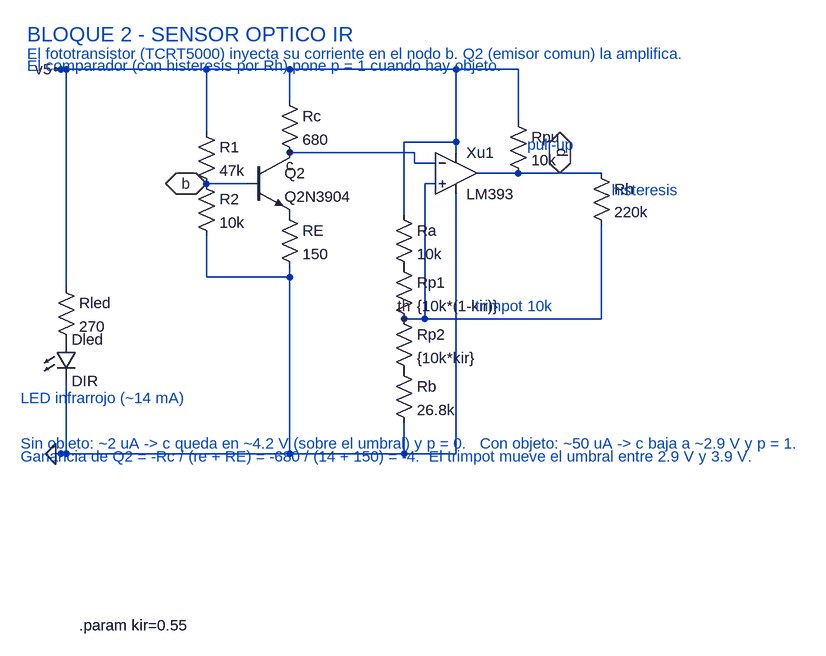
[diagram p0: schematic BLOQUE_SENSOR_IR.asc]
BLOQUE_SENSOR_IR.asc, the LTspice schematic file:
Version 4
SHEET 1 1100 700
WIRE 96 80 160 80
WIRE 224 32 416 32
WIRE 416 32 416 48
WIRE 416 48 448 48
WIRE 400 288 432 288
WIRE 432 288 432 80
WIRE 432 80 448 80
WIRE 512 64 576 64
WIRE 576 64 640 64
WIRE 640 64 704 64
WIRE 704 144 704 288
WIRE 704 288 432 288
WIRE -136 -96 576 -96
WIRE -136 -96 -128 -96
WIRE 224 -48 224 -96
WIRE 576 -16 576 -96
WIRE 96 0 96 -96
WIRE 480 32 480 -96
WIRE 400 128 400 16
WIRE 400 16 480 16
WIRE -120 240 -120 -96
WIRE -136 496 480 496
WIRE -136 496 -128 496
WIRE 400 448 400 496
WIRE -120 384 -120 496
WIRE 224 208 224 496
WIRE 96 160 96 224
WIRE 96 224 224 224
WIRE 480 96 480 496
FLAG 96 80 b
FLAG 224 32 c
FLAG 400 288 th
FLAG 640 64 p
FLAG -136 -96 v5
FLAG -136 496 0
IOPIN 96 80 BiDir
IOPIN 640 64 BiDir
SYMBOL res -136 224 R0
SYMATTR InstName Rled
SYMATTR Value 270
SYMBOL LED -136 320 R0
SYMATTR InstName Dled
SYMATTR Value DIR
SYMBOL res 80 -16 R0
SYMATTR InstName R1
SYMATTR Value 47k
SYMBOL res 80 64 R0
SYMATTR InstName R2
SYMATTR Value 10k
SYMBOL npn 160 32 R0
SYMATTR InstName Q2
SYMATTR Value Q2N3904
SYMBOL res 208 -64 R0
SYMATTR InstName Rc
SYMATTR Value 680
SYMBOL res 208 112 R0
SYMATTR InstName RE
SYMATTR Value 150
SYMBOL res 384 112 R0
SYMATTR InstName Ra
SYMATTR Value 10k
SYMBOL res 384 192 R0
SYMATTR InstName Rp1
SYMATTR Value {10k*(1-kir)}
SYMBOL res 384 272 R0
SYMATTR InstName Rp2
SYMATTR Value {10k*kir}
SYMBOL res 384 352 R0
SYMATTR InstName Rb
SYMATTR Value 26.8k
SYMBOL OpAmps\opamp2 480 0 R0
SYMATTR InstName Xu1
SYMATTR Value LM393
SYMBOL res 560 -32 R0
SYMATTR InstName Rpu
SYMATTR Value 10k
SYMBOL res 688 48 R0
SYMATTR InstName Rh
SYMATTR Value 220k
TEXT -180 -150 Left 3 ;BLOQUE 2 - SENSOR OPTICO IR
TEXT -180 -120 Left 2 ;El fototransistor (TCRT5000) inyecta su corriente en el nodo b. Q2 (emisor comun) la amplifica.
TEXT -180 -102 Left 2 ;El comparador (con histeresis por Rh) pone p = 1 cuando hay objeto.
TEXT -190 410 Left 2 ;LED infrarrojo (~14 mA)
TEXT 510 268 Left 2 ;trimpot 10k
TEXT 720 90 Left 2 ;histeresis
TEXT 590 20 Left 2 ;pull-up
TEXT -190 480 Left 2 ;Sin objeto: ~2 uA -> c queda en ~4.2 V (sobre el umbral) y p = 0.   Con objeto: ~50 uA -> c baja a ~2.9 V y p = 1.
TEXT -190 500 Left 2 ;Ganancia de Q2 = -Rc / (re + RE) = -680 / (14 + 150) = -4.  El trimpot mueve el umbral entre 2.9 V y 3.9 V.
TEXT -100 760 Left 2 !.param kir=0.55

The netlist it stands for:
* BLOQUE_SENSOR_IR.asc
Rled v5 P001 270
Dled P001 0 DIR
R1 v5 b 47k
R2 b 0 10k
Q2 c b P002 0 Q2N3904
Rc v5 c 680
RE P002 0 150
Ra v5 P003 10k
Rp1 P003 th {10k*(1-kir)}
Rp2 th P004 {10k*kir}
Rb P004 0 26.8k
XXu1 th c v5 0 p LM393  ; pins In+ In- V+ V- OUT
Rpu v5 p 10k
Rh p th 220k
.model D D
.lib standard.dio
.model NPN NPN
.model PNP PNP
.lib standard.bjt
* BLOQUE 2 - SENSOR OPTICO IR
* El fototransistor (TCRT5000) inyecta su corriente en el nodo b. Q2 (emisor comun) la amplifica.
* El comparador (con histeresis por Rh) pone p = 1 cuando hay objeto.
* LED infrarrojo (~14 mA)
* trimpot 10k
* histeresis
* pull-up
* Sin objeto: ~2 uA -> c queda en ~4.2 V (sobre el umbral) y p = 0.   Con objeto: ~50 uA -> c baja a ~2.9 V y p = 1.
* Ganancia de Q2 = -Rc / (re + RE) = -680 / (14 + 150) = -4.  El trimpot mueve el umbral entre 2.9 V y 3.9 V.
.param kir=0.55
.backanno
.end